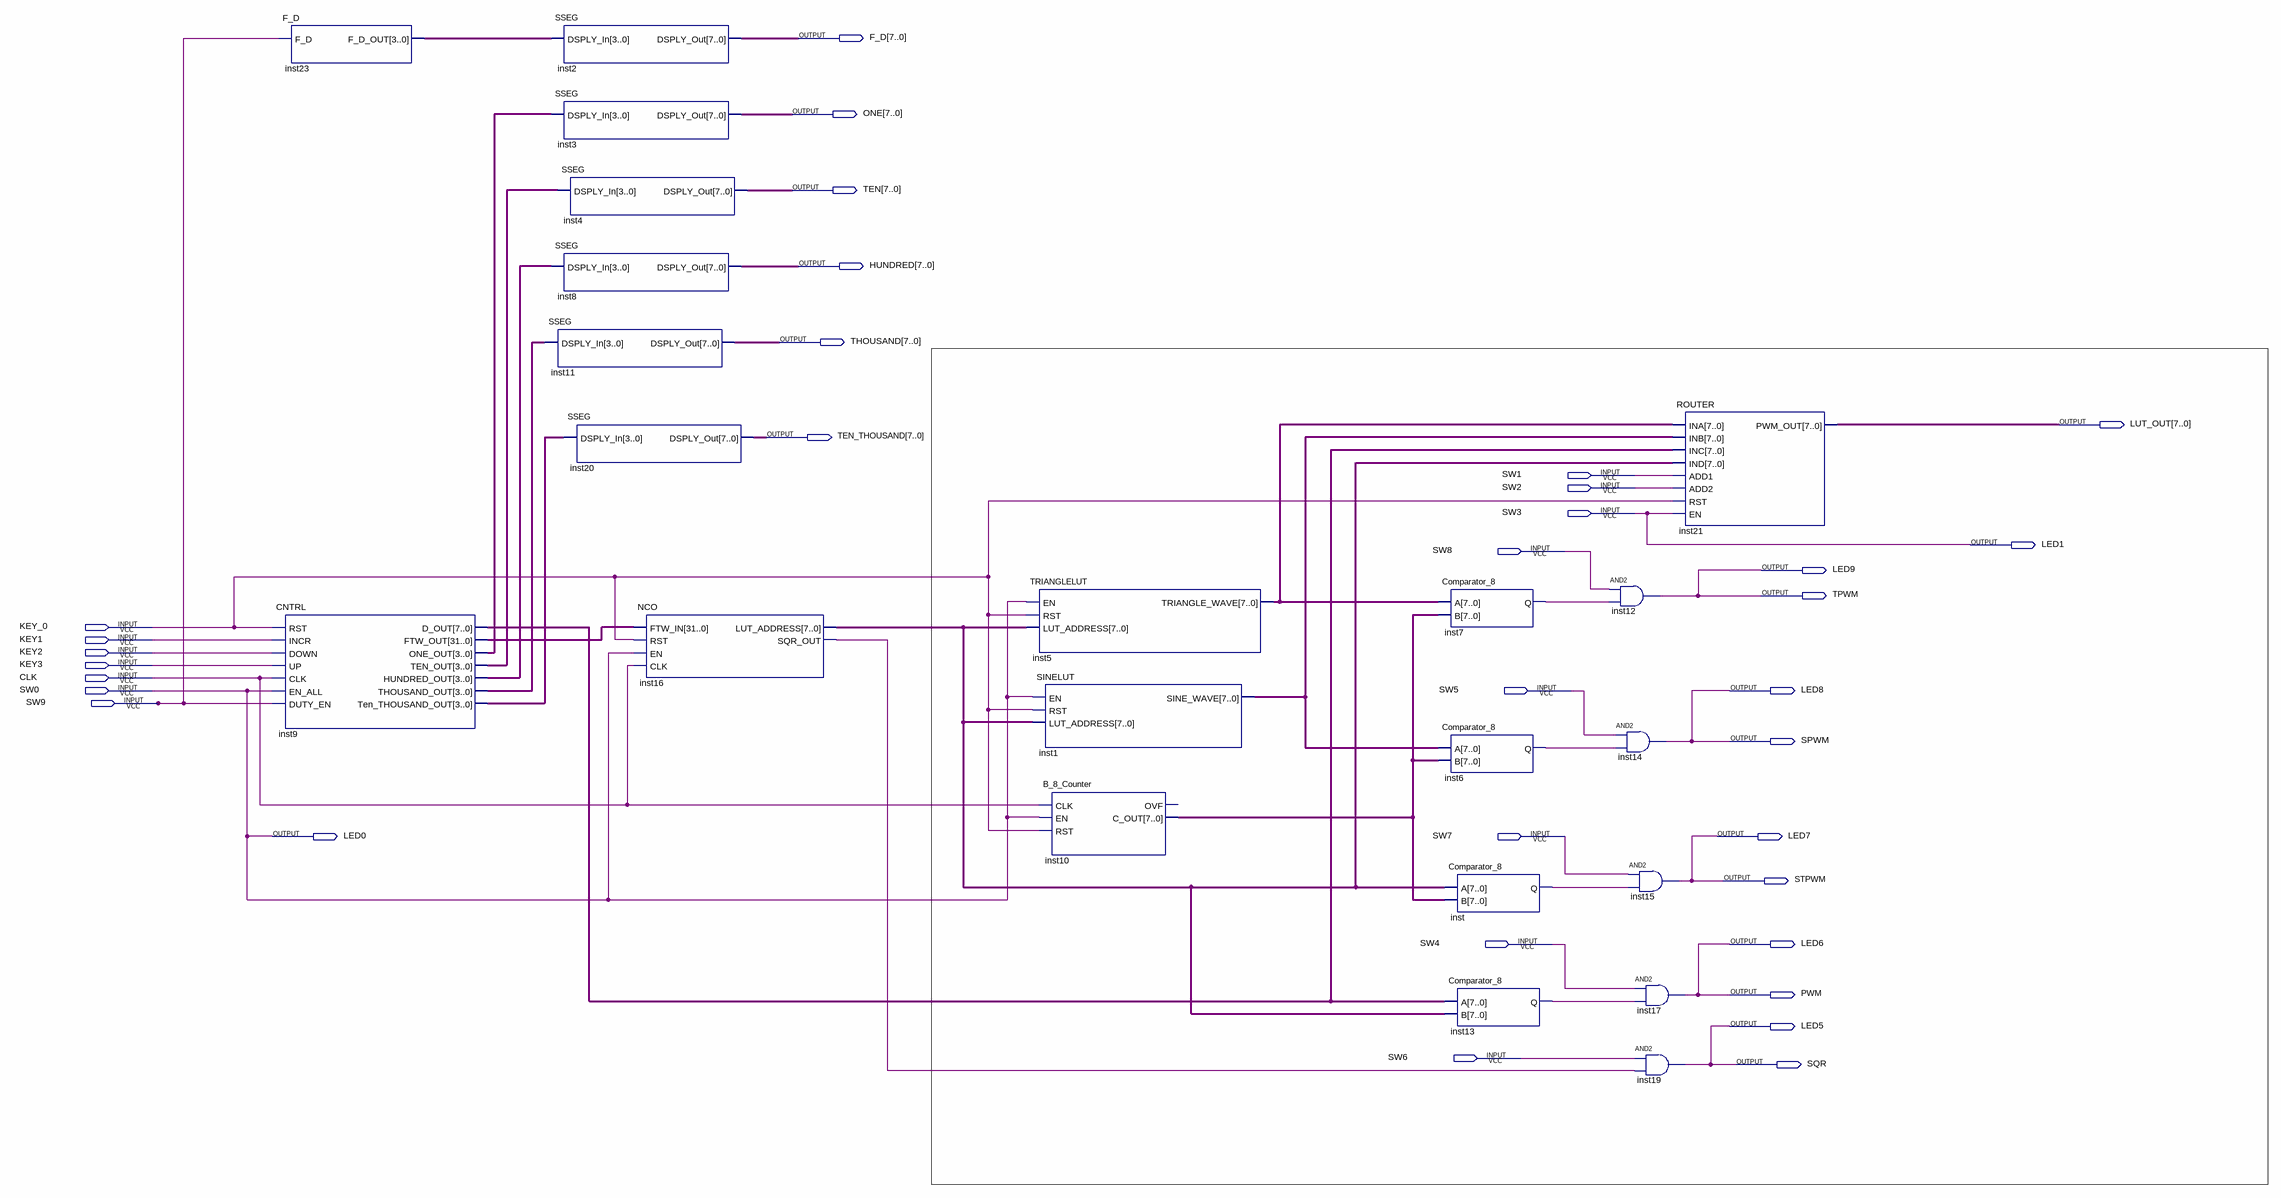
[diagram p0: schematic sheet]
// Quartus schematic Function_Generator_1.bdf as structural Verilog: 22 symbols, 34 pins
module Function_Generator_1 (
  input  SW1,
  input  SW2,
  input  SW3,
  input  SW8,
  input  KEY_0,
  input  KEY1,
  input  KEY2,
  input  KEY3,
  input  CLK,
  input  SW0,
  input  SW5,
  input  SW9,
  input  SW7,
  input  SW4,
  input  SW6,
  output [7:0] F_D,
  output [7:0] ONE,
  output [7:0] TEN,
  output [7:0] HUNDRED,
  output [7:0] THOUSAND,
  output [7:0] LUT_OUT,
  output [7:0] TEN_THOUSAND,
  output LED1,
  output LED9,
  output TPWM,
  output LED8,
  output SPWM,
  output LED0,
  output LED7,
  output STPWM,
  output LED6,
  output PWM,
  output LED5,
  output SQR
);

  wire inst6_q, inst7_q, inst13_q, inst16_sqr_out, inst_q;
  wire [3:0] inst9_hundred_out, inst9_one_out, inst9_ten_out, inst9_ten_thousand_out, inst9_thousand_out,
       inst23_f_d_out;
  wire [7:0] inst1_sine_wave, inst5_triangle_wave, inst9_d_out, inst10_c_out, inst16_lut_address;
  wire [31:0] inst9_ftw_out;

  F_D inst23 (.F_D(SW9), .F_D_OUT(inst23_f_d_out));
  CNTRL inst9 (
    .RST(KEY_0), .INCR(KEY1), .DOWN(KEY2), .UP(KEY3), .CLK(CLK), .EN_ALL(SW0), .DUTY_EN(SW9),
    .D_OUT(inst9_d_out), .FTW_OUT(inst9_ftw_out), .ONE_OUT(inst9_one_out), .TEN_OUT(inst9_ten_out),
    .HUNDRED_OUT(inst9_hundred_out), .THOUSAND_OUT(inst9_thousand_out),
    .Ten_THOUSAND_OUT(inst9_ten_thousand_out));
  SSEG inst2 (.DSPLY_In(inst23_f_d_out), .DSPLY_Out(F_D));
  SSEG inst3 (.DSPLY_In(inst9_one_out), .DSPLY_Out(ONE));
  SSEG inst4 (.DSPLY_In(inst9_ten_out), .DSPLY_Out(TEN));
  SSEG inst8 (.DSPLY_In(inst9_hundred_out), .DSPLY_Out(HUNDRED));
  SSEG inst11 (.DSPLY_In(inst9_thousand_out), .DSPLY_Out(THOUSAND));
  SSEG inst20 (.DSPLY_In(inst9_ten_thousand_out), .DSPLY_Out(TEN_THOUSAND));
  NCO inst16 (
    .FTW_IN(inst9_ftw_out), .RST(KEY_0), .EN(SW0), .CLK(CLK), .LUT_ADDRESS(inst16_lut_address),
    .SQR_OUT(inst16_sqr_out));
  TRIANGLELUT inst5 (.EN(SW0), .RST(KEY_0), .LUT_ADDRESS(inst16_lut_address), .TRIANGLE_WAVE(inst5_triangle_wave));
  SINELUT inst1 (.EN(SW0), .RST(KEY_0), .LUT_ADDRESS(inst16_lut_address), .SINE_WAVE(inst1_sine_wave));
  B_8_Counter inst10 (.CLK(CLK), .EN(SW0), .RST(KEY_0), .C_OUT(inst10_c_out));  // open: OVF
  Comparator_8 inst7 (.A(inst5_triangle_wave), .B(inst10_c_out), .Q(inst7_q));
  Comparator_8 inst6 (.A(inst1_sine_wave), .B(inst10_c_out), .Q(inst6_q));
  Comparator_8 inst (.A(inst16_lut_address), .B(inst10_c_out), .Q(inst_q));
  Comparator_8 inst13 (.A(inst9_d_out), .B(inst16_lut_address), .Q(inst13_q));
  and inst12 (LED9, SW8, inst7_q);
  and inst14 (LED8, SW5, inst6_q);
  and inst15 (LED7, SW7, inst_q);
  and inst17 (LED6, SW4, inst13_q);
  and inst19 (LED5, SW6, inst16_sqr_out);
  ROUTER inst21 (
    .INA(inst5_triangle_wave), .INB(inst1_sine_wave), .INC(inst9_d_out), .IND(inst16_lut_address),
    .ADD1(SW1), .ADD2(SW2), .RST(KEY_0), .EN(SW3), .PWM_OUT(LUT_OUT));

  assign LED0 = SW0;
  assign LED1 = SW3;
  assign PWM = LED6;
  assign SPWM = LED8;
  assign SQR = LED5;
  assign STPWM = LED7;
  assign TPWM = LED9;
endmodule
